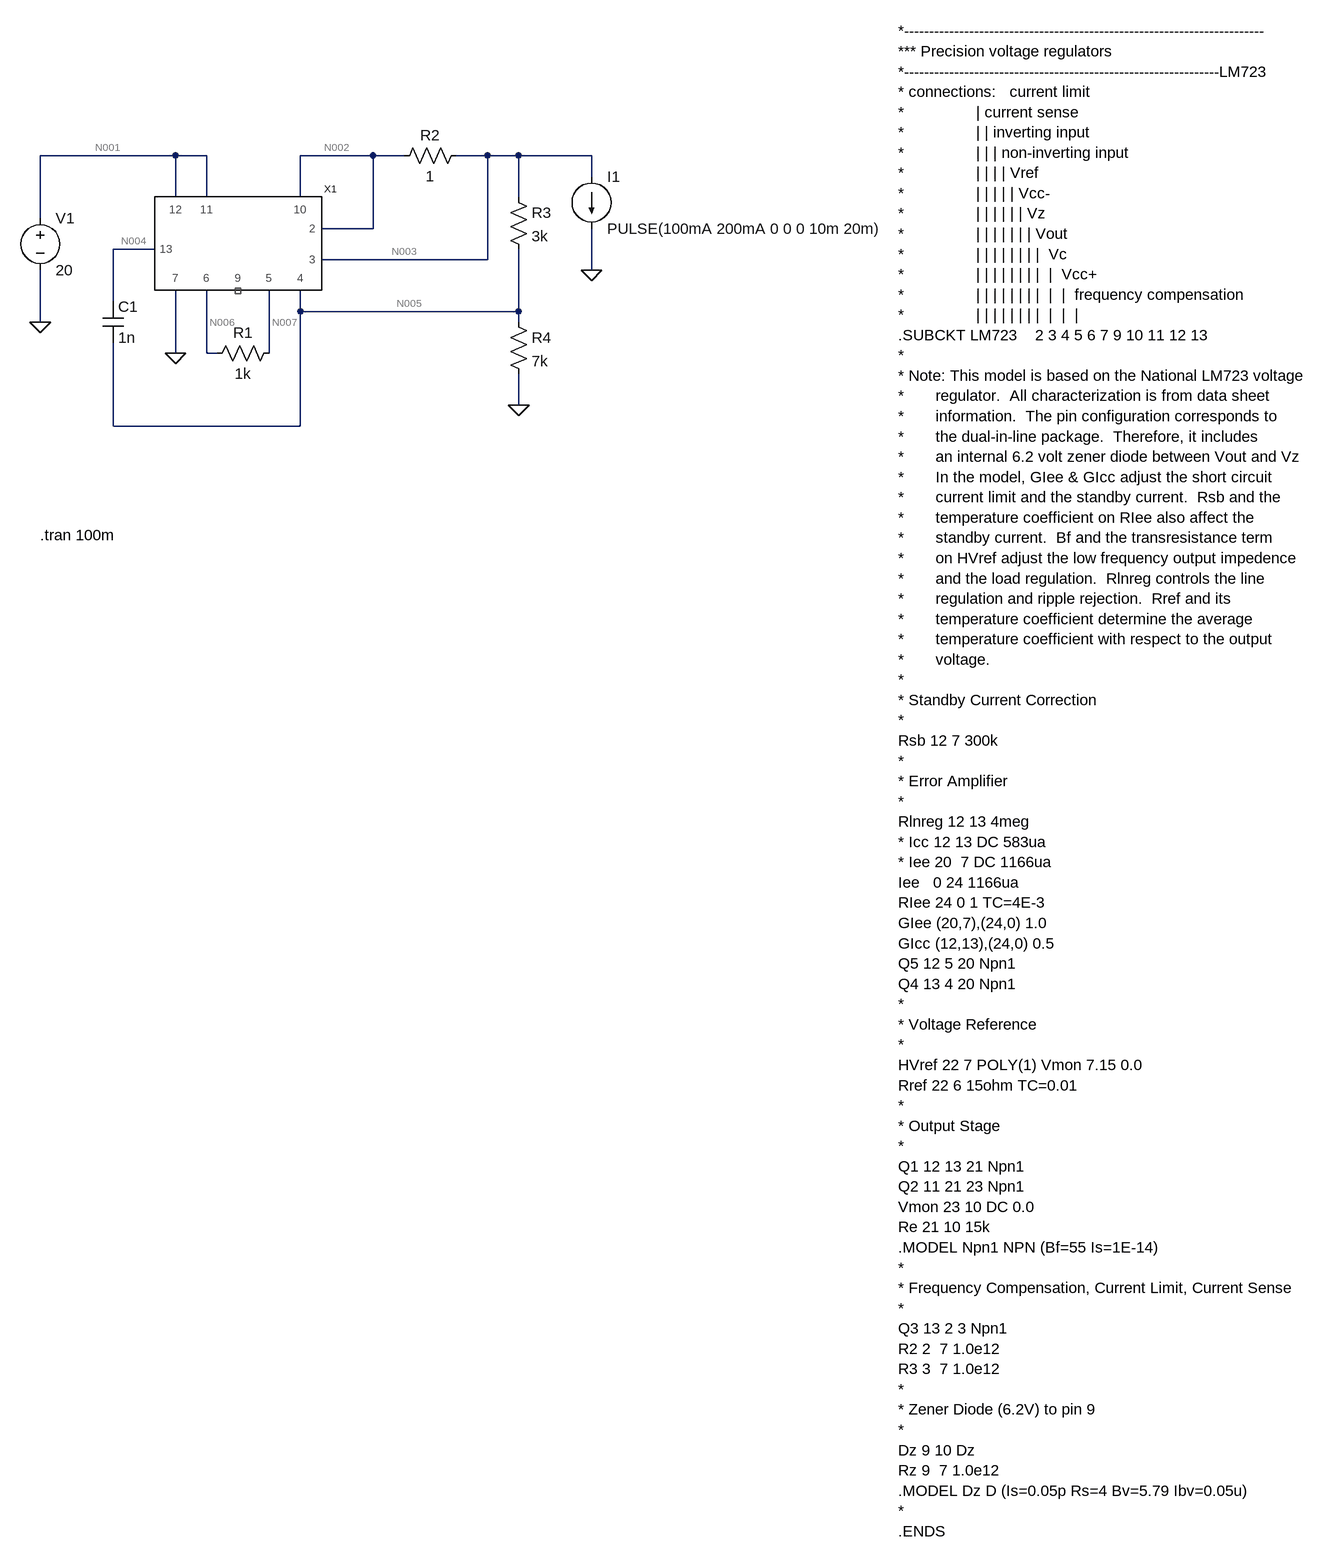
[diagram p0: schematic typ_aplication.asc]
typ_aplication.asc, the LTspice schematic file:
Version 4
SHEET 1 2652 1644
WIRE 784 -272 576 -272
WIRE 832 -272 784 -272
WIRE 1088 -272 976 -272
WIRE 1136 -272 1088 -272
WIRE 1264 -272 1216 -272
WIRE 1312 -272 1264 -272
WIRE 1424 -272 1312 -272
WIRE 1424 -240 1424 -272
WIRE 784 -208 784 -272
WIRE 832 -208 832 -272
WIRE 976 -208 976 -272
WIRE 1312 -208 1312 -272
WIRE 576 -176 576 -272
WIRE 1088 -160 1088 -272
WIRE 1088 -160 1008 -160
WIRE 752 -128 688 -128
WIRE 1264 -112 1264 -272
WIRE 1264 -112 1008 -112
WIRE 1424 -96 1424 -160
WIRE 688 -48 688 -128
WIRE 976 -32 976 -64
WIRE 1312 -32 1312 -128
WIRE 1312 -32 976 -32
WIRE 576 -16 576 -96
WIRE 1312 -16 1312 -32
WIRE 784 32 784 -64
WIRE 832 32 832 -64
WIRE 848 32 832 32
WIRE 928 32 928 -64
WIRE 1312 112 1312 64
WIRE 688 144 688 16
WIRE 976 144 976 -32
WIRE 976 144 688 144
FLAG 576 -16 0
FLAG 784 32 0
FLAG 1312 112 0
FLAG 1424 -96 0
SYMBOL LM723 880 -128 R0
SYMATTR InstName X1
SYMATTR Prefix X
SYMATTR SpiceModel LM723
SYMBOL voltage 576 -192 R0
WINDOW 123 0 0 Left 2
WINDOW 39 0 0 Left 2
SYMATTR InstName V1
SYMATTR Value 20
SYMBOL res 944 16 R90
WINDOW 0 0 56 VBottom 2
WINDOW 3 32 56 VTop 2
SYMATTR InstName R1
SYMATTR Value 1k
SYMBOL res 1232 -288 R90
WINDOW 0 0 56 VBottom 2
WINDOW 3 32 56 VTop 2
SYMATTR InstName R2
SYMATTR Value 1
SYMBOL res 1296 -224 R0
SYMATTR InstName R3
SYMATTR Value 3k
SYMBOL res 1296 -32 R0
SYMATTR InstName R4
SYMATTR Value 7k
SYMBOL cap 672 -48 R0
SYMATTR InstName C1
SYMATTR Value 1n
SYMBOL current 1424 -240 R0
WINDOW 123 0 0 Left 2
WINDOW 39 0 0 Left 2
SYMATTR InstName I1
SYMATTR Value PULSE(100mA 200mA 0 0 0 10m 20m)
TEXT 1896 -464 Left 2 !*------------------------------------------------------------------------\n*** Precision voltage regulators\n*---------------------------------------------------------------LM723\n* connections:   current limit\n*                | current sense\n*                | | inverting input\n*                | | | non-inverting input\n*                | | | | Vref\n*                | | | | | Vcc-\n*                | | | | | | Vz\n*                | | | | | | | Vout\n*                | | | | | | | |  Vc\n*                | | | | | | | |  |  Vcc+\n*                | | | | | | | |  |  |  frequency compensation\n*                | | | | | | | |  |  |  |\n.SUBCKT LM723    2 3 4 5 6 7 9 10 11 12 13\n*\n* Note: This model is based on the National LM723 voltage\n*       regulator.  All characterization is from data sheet\n*       information.  The pin configuration corresponds to\n*       the dual-in-line package.  Therefore, it includes\n*       an internal 6.2 volt zener diode between Vout and Vz\n*       In the model, GIee & GIcc adjust the short circuit\n*       current limit and the standby current.  Rsb and the\n*       temperature coefficient on RIee also affect the\n*       standby current.  Bf and the transresistance term\n*       on HVref adjust the low frequency output impedence\n*       and the load regulation.  Rlnreg controls the line\n*       regulation and ripple rejection.  Rref and its\n*       temperature coefficient determine the average\n*       temperature coefficient with respect to the output\n*       voltage.\n*\n* Standby Current Correction\n*\nRsb 12 7 300k\n*\n* Error Amplifier\n*\nRlnreg 12 13 4meg\n* Icc 12 13 DC 583ua\n* Iee 20  7 DC 1166ua\nIee   0 24 1166ua\nRIee 24 0 1 TC=4E-3\nGIee (20,7),(24,0) 1.0\nGIcc (12,13),(24,0) 0.5\nQ5 12 5 20 Npn1\nQ4 13 4 20 Npn1\n*\n* Voltage Reference\n*\nHVref 22 7 POLY(1) Vmon 7.15 0.0\nRref 22 6 15ohm TC=0.01\n*\n* Output Stage\n*\nQ1 12 13 21 Npn1\nQ2 11 21 23 Npn1\nVmon 23 10 DC 0.0\nRe 21 10 15k\n.MODEL Npn1 NPN (Bf=55 Is=1E-14)\n*\n* Frequency Compensation, Current Limit, Current Sense\n*\nQ3 13 2 3 Npn1\nR2 2  7 1.0e12\nR3 3  7 1.0e12\n*\n* Zener Diode (6.2V) to pin 9\n*\nDz 9 10 Dz\nRz 9  7 1.0e12\n.MODEL Dz D (Is=0.05p Rs=4 Bv=5.79 Ibv=0.05u)\n*\n.ENDS
TEXT 576 312 Left 2 !.tran 100m

The netlist it stands for:
* typ_aplication.asc
XX1 N002 N003 N005 N007 N006 0 NC_01 N002 N001 N001 N004 LM723  ; pins 2 3 4 5 6 7 9 10 11 12 13
V1 N001 0 20
R1 N007 N006 1k
R2 N003 N002 1
R3 N003 N005 3k
R4 N005 0 7k
C1 N004 N005 1n
I1 N003 0 PULSE(100mA 200mA 0 0 0 10m 20m)
*------------------------------------------------------------------------
*** Precision voltage regulators
*---------------------------------------------------------------LM723
* connections:   current limit
*                | current sense
*                | | inverting input
*                | | | non-inverting input
*                | | | | Vref
*                | | | | | Vcc-
*                | | | | | | Vz
*                | | | | | | | Vout
*                | | | | | | | |  Vc
*                | | | | | | | |  |  Vcc+
*                | | | | | | | |  |  |  frequency compensation
*                | | | | | | | |  |  |  |
.SUBCKT LM723    2 3 4 5 6 7 9 10 11 12 13
*
* Note: This model is based on the National LM723 voltage
*       regulator.  All characterization is from data sheet
*       information.  The pin configuration corresponds to
*       the dual-in-line package.  Therefore, it includes
*       an internal 6.2 volt zener diode between Vout and Vz
*       In the model, GIee & GIcc adjust the short circuit
*       current limit and the standby current.  Rsb and the
*       temperature coefficient on RIee also affect the
*       standby current.  Bf and the transresistance term
*       on HVref adjust the low frequency output impedence
*       and the load regulation.  Rlnreg controls the line
*       regulation and ripple rejection.  Rref and its
*       temperature coefficient determine the average
*       temperature coefficient with respect to the output
*       voltage.
*
* Standby Current Correction
*
Rsb 12 7 300k
*
* Error Amplifier
*
Rlnreg 12 13 4meg
* Icc 12 13 DC 583ua
* Iee 20  7 DC 1166ua
Iee   0 24 1166ua
RIee 24 0 1 TC=4E-3
GIee (20,7),(24,0) 1.0
GIcc (12,13),(24,0) 0.5
Q5 12 5 20 Npn1
Q4 13 4 20 Npn1
*
* Voltage Reference
*
HVref 22 7 POLY(1) Vmon 7.15 0.0
Rref 22 6 15ohm TC=0.01
*
* Output Stage
*
Q1 12 13 21 Npn1
Q2 11 21 23 Npn1
Vmon 23 10 DC 0.0
Re 21 10 15k
.MODEL Npn1 NPN (Bf=55 Is=1E-14)
*
* Frequency Compensation, Current Limit, Current Sense
*
Q3 13 2 3 Npn1
R2 2  7 1.0e12
R3 3  7 1.0e12
*
* Zener Diode (6.2V) to pin 9
*
Dz 9 10 Dz
Rz 9  7 1.0e12
.MODEL Dz D (Is=0.05p Rs=4 Bv=5.79 Ibv=0.05u)
*
.ENDS
.tran 100m
.backanno
.end

* Results of the author's LTspice run, read from the files saved beside the schematic
* Operating Point, zero values left out:
*   V(n001) = 20 V
*   V(n004) = 11.77 V
*   V(n007) = 7.139 V
*   V(n005) = 7.137 V
*   V(n006) = 7.15 V
*   V(n002) = 10.33 V
*   V(n003) = 10.23 V
*   I(I1) = 100 mA
*   I(R1) = -10.79 µA
*   I(R2) = -101 mA
*   I(R3) = 1.03 mA
*   I(R4) = 1.02 mA
*   I(V1) = -102.2 mA
*   Ix(x1:2) = 8.982 pA
*   Ix(x1:3) = 9.619 pA
*   Ix(x1:4) = 10.04 µA
*   Ix(x1:5) = 10.79 µA
*   Ix(x1:6) = -10.79 µA
*   Ix(x1:7) = -1.222 mA
*   Ix(x1:10) = -101 mA
*   Ix(x1:11) = 99.17 mA
*   Ix(x1:12) = 3.067 mA
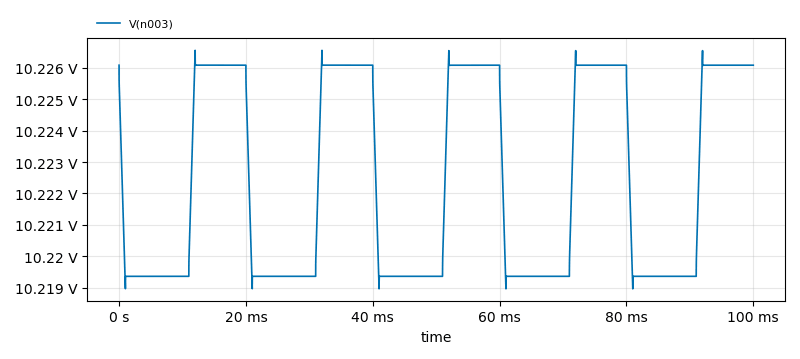
[diagram p1: Transient Analysis of typ_aplication.asc, plotted from the saved traces]
* Transient Analysis, 1 run:
*   V(n003): min 10.22 V, max 10.23 V, average 10.22 V, rms 10.22 V, last 10.23 V